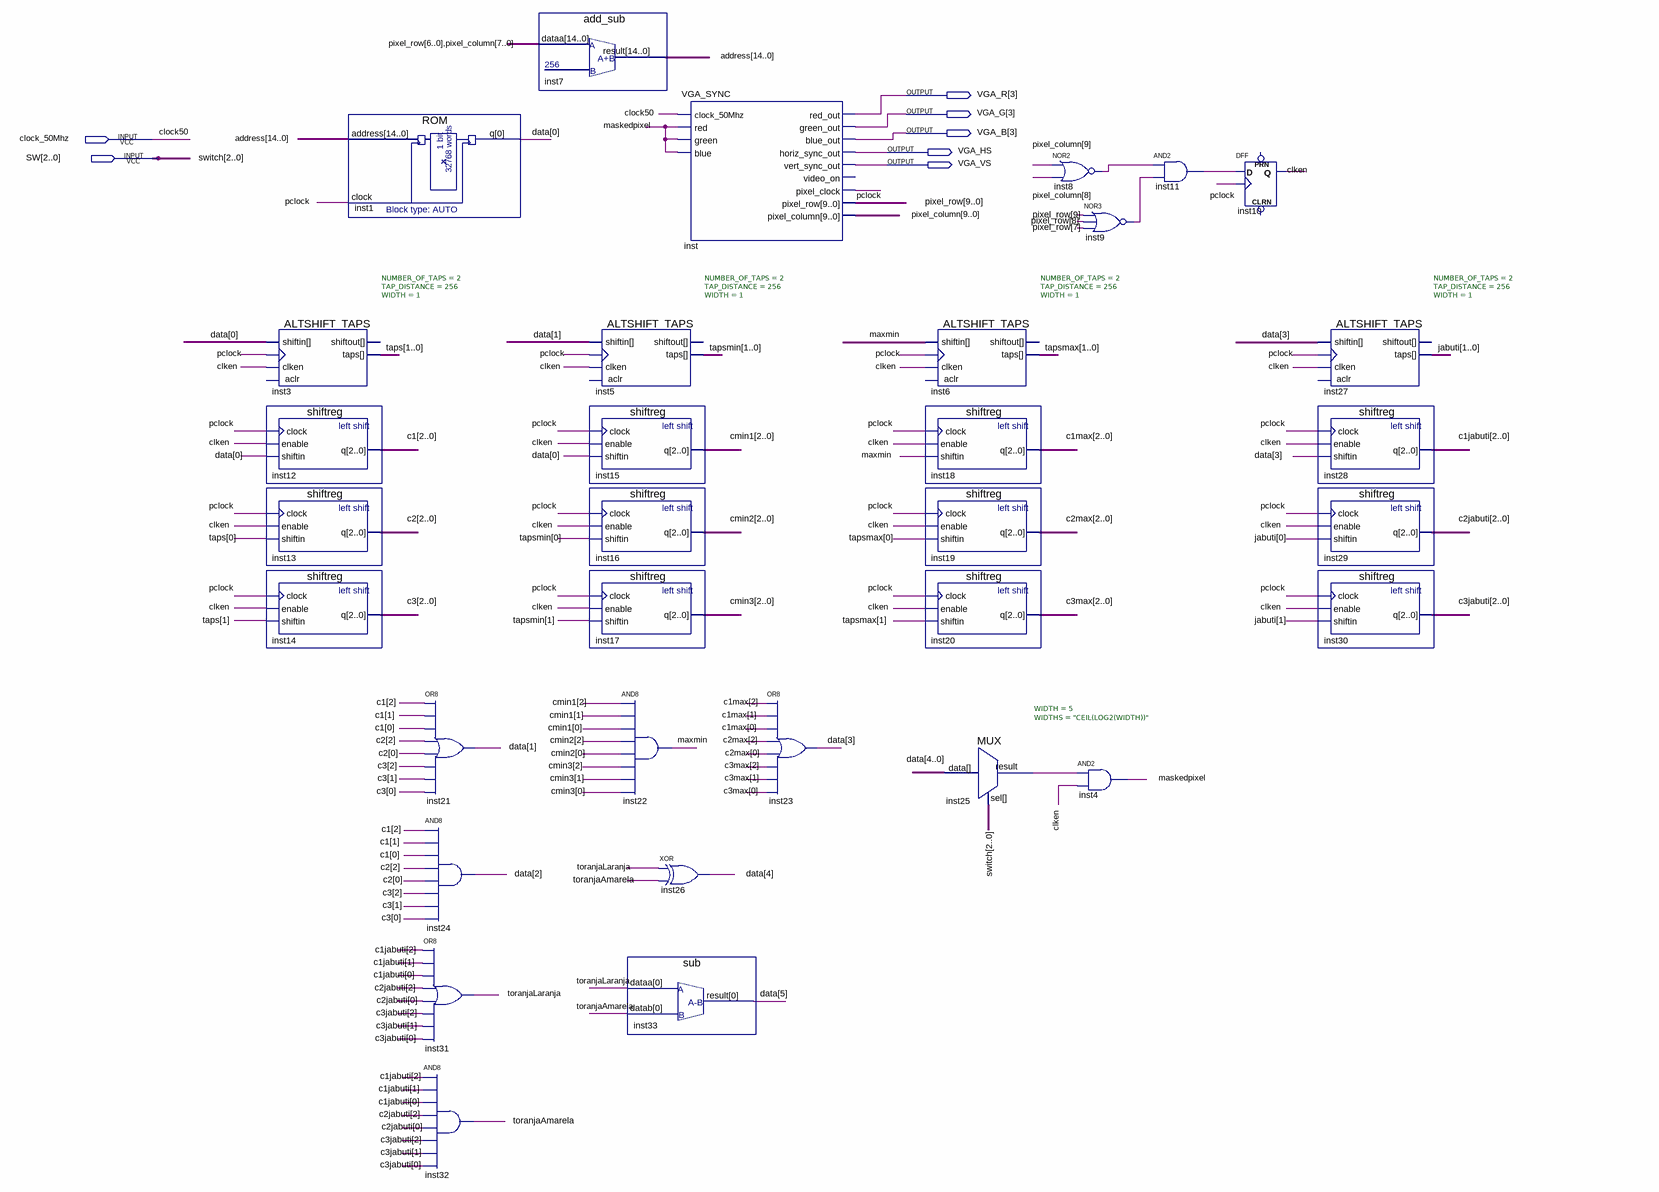
[diagram p0: schematic sheet]
// Quartus schematic filtroimagem.bdf as structural Verilog: 33 symbols, 7 pins
module filtroimagem (
  input  clock_50Mhz,
  input  [2:0] SW,
  output [3:3] VGA_R,
  output [3:3] VGA_G,
  output [3:3] VGA_B,
  output VGA_HS,
  output VGA_VS
);

  wire clken, inst8_out, inst9_out, inst11_out, inst25_result, maskedpixel, maxmin, pclock, toranjaAmarela,
       toranjaLaranja;
  wire [1:0] jabuti, taps, tapsmax, tapsmin;
  wire [2:0] c1, c1jabuti, c1max, c2, c2jabuti, c2max, c3, c3jabuti, c3max, cmin1, cmin2, cmin3;
  wire [5:0] data;
  wire [9:0] pixel_column, pixel_row;
  wire [14:0] address;

  ALTSHIFT_TAPS #(.NUMBER_OF_TAPS(2), .TAP_DISTANCE(256), .WIDTH(1)) inst3 (
    .shiftin(data[0]), .clken(clken), .clock(pclock), .taps(taps));  // open: aclr, shiftout
  shiftreg inst12 (.clock(pclock), .enable(clken), .shiftin(data[0]), .q(c1));
  shiftreg inst13 (.clock(pclock), .enable(clken), .shiftin(taps[0]), .q(c2));
  shiftreg inst14 (.clock(pclock), .enable(clken), .shiftin(taps[1]), .q(c3));
  ROM inst1 (.address(address), .clock(pclock), .q(data[0]));
  or inst21 (data[1], c1[2], c1[1], c1[0], c2[2], c2[0], c3[2], c3[1], c3[0]);
  and inst24 (data[2], c1[2], c1[1], c1[0], c2[2], c2[0], c3[2], c3[1], c3[0]);
  or inst31 (toranjaLaranja, c1jabuti[2], c1jabuti[1], c1jabuti[0], c2jabuti[2], c2jabuti[0], c3jabuti[2], c3jabuti[1], c3jabuti[0]);
  and inst32 (toranjaAmarela, c1jabuti[2], c1jabuti[1], c1jabuti[0], c2jabuti[2], c2jabuti[0], c3jabuti[2], c3jabuti[1], c3jabuti[0]);
  add_sub inst7 (.dataa({pixel_row[6:0], pixel_column[7:0]}), .result(address));
  ALTSHIFT_TAPS #(.NUMBER_OF_TAPS(2), .TAP_DISTANCE(256), .WIDTH(1)) inst5 (
    .shiftin(data[1]), .clken(clken), .clock(pclock), .taps(tapsmin));  // open: aclr, shiftout
  shiftreg inst15 (.clock(pclock), .enable(clken), .shiftin(data[0]), .q(cmin1));
  shiftreg inst16 (.clock(pclock), .enable(clken), .shiftin(tapsmin[0]), .q(cmin2));
  shiftreg inst17 (.clock(pclock), .enable(clken), .shiftin(tapsmin[1]), .q(cmin3));
  and inst22 (maxmin, cmin1[2], cmin1[1], cmin1[0], cmin2[2], cmin2[0], cmin3[2], cmin3[1], cmin3[0]);
  xor inst26 (data[4], toranjaLaranja, toranjaAmarela);
  sub inst33 (.dataa(toranjaLaranja), .datab(toranjaAmarela), .result(data[5]));
  VGA_SYNC inst (
    .clock_50Mhz(clock_50Mhz), .red(maskedpixel), .green(maskedpixel), .blue(maskedpixel),
    .red_out(VGA_R[3]), .green_out(VGA_G[3]), .blue_out(VGA_B[3]), .horiz_sync_out(VGA_HS),
    .vert_sync_out(VGA_VS), .pixel_clock(pclock), .pixel_row(pixel_row), .pixel_column(pixel_column));  // open: video_on
  or inst23 (data[3], c1max[2], c1max[1], c1max[0], c2max[2], c2max[0], c3max[2], c3max[1], c3max[0]);
  ALTSHIFT_TAPS #(.NUMBER_OF_TAPS(2), .TAP_DISTANCE(256), .WIDTH(1)) inst6 (
    .shiftin(maxmin), .clken(clken), .clock(pclock), .taps(tapsmax));  // open: aclr, shiftout
  shiftreg inst18 (.clock(pclock), .enable(clken), .shiftin(maxmin), .q(c1max));
  shiftreg inst19 (.clock(pclock), .enable(clken), .shiftin(tapsmax[0]), .q(c2max));
  shiftreg inst20 (.clock(pclock), .enable(clken), .shiftin(tapsmax[1]), .q(c3max));
  MUX #(.WIDTH(5), .WIDTHS("CEIL(LOG2(WIDTH))")) inst25 (.data(data[4:0]), .sel(SW), .result(inst25_result));
  nor inst8 (inst8_out, pixel_column[9], pixel_column[8]);
  nor inst9 (inst9_out, pixel_row[9], pixel_row[8], pixel_row[7]);
  and inst4 (maskedpixel, inst25_result, clken);
  and inst11 (inst11_out, inst8_out, inst9_out);
  DFF inst10 (.CLK(pclock), .D(inst11_out), .Q(clken));  // open: CLRN, PRN
  ALTSHIFT_TAPS #(.NUMBER_OF_TAPS(2), .TAP_DISTANCE(256), .WIDTH(1)) inst27 (
    .shiftin(data[3]), .clken(clken), .clock(pclock), .taps(jabuti));  // open: aclr, shiftout
  shiftreg inst28 (.clock(pclock), .enable(clken), .shiftin(data[3]), .q(c1jabuti));
  shiftreg inst29 (.clock(pclock), .enable(clken), .shiftin(jabuti[0]), .q(c2jabuti));
  shiftreg inst30 (.clock(pclock), .enable(clken), .shiftin(jabuti[1]), .q(c3jabuti));

  // Other names for the same wires on the sheet: clock50 = clock_50Mhz; switch[2:0] = SW
endmodule
